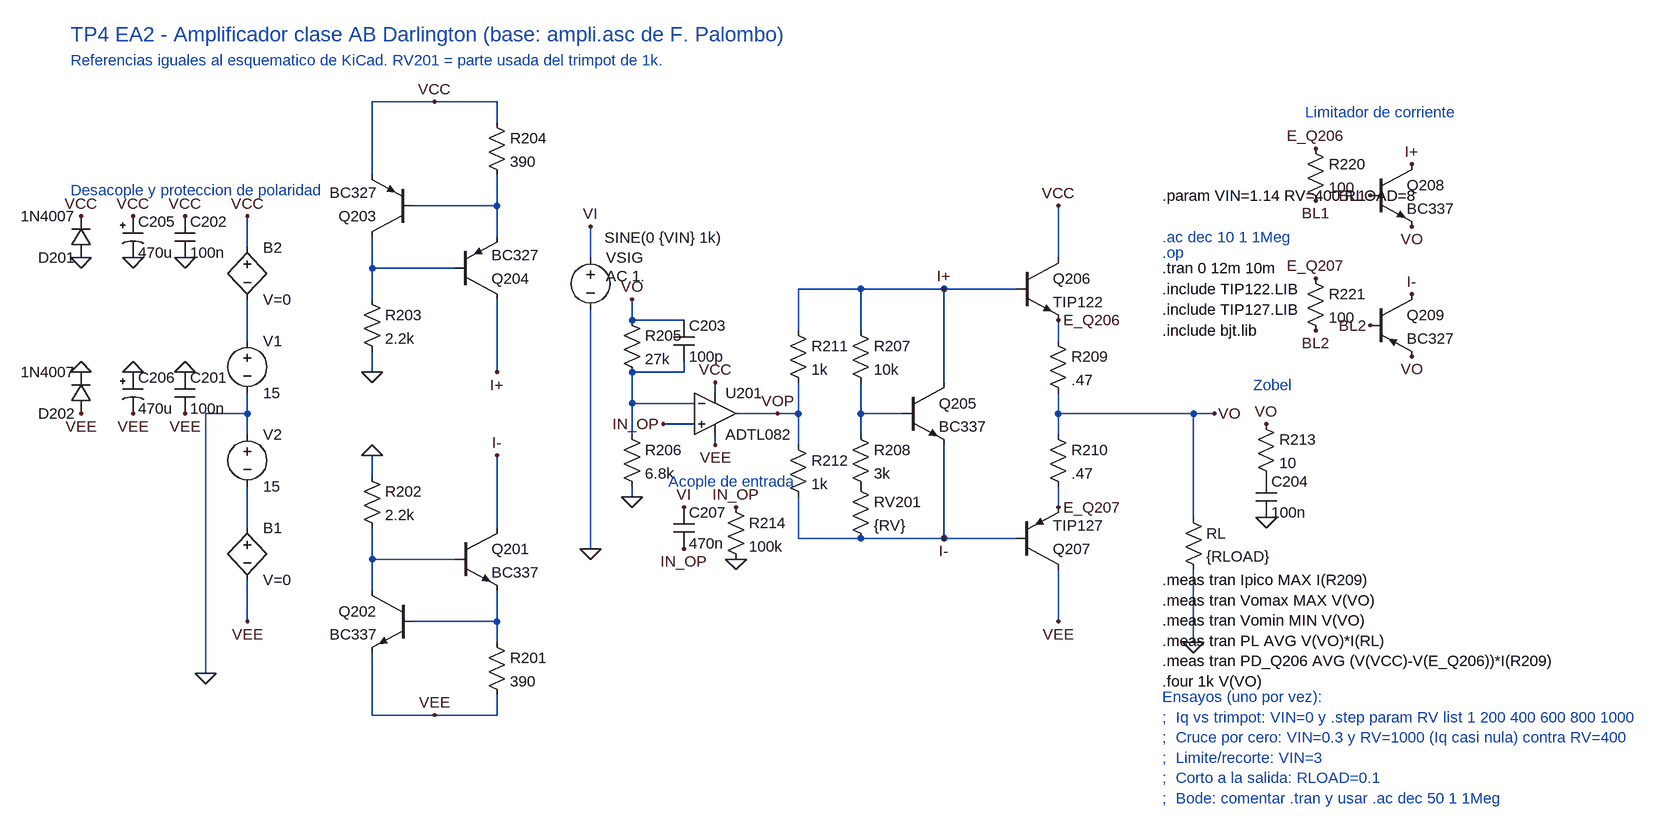
[diagram p0: schematic ampli.asc]
ampli.asc, the LTspice schematic file:
Version 4.1
SHEET 1 1440 1176
WIRE -640 -176 -736 -176
WIRE -544 -176 -640 -176
WIRE -544 -144 -544 -176
WIRE -736 -64 -736 -176
WIRE -544 -16 -544 -64
WIRE -544 -16 -672 -16
WIRE -544 32 -544 -16
WIRE -928 48 -928 0
WIRE -400 64 -400 16
WIRE 320 64 320 -16
WIRE -736 80 -736 32
WIRE -608 80 -736 80
WIRE 16 112 -80 112
WIRE 144 112 16 112
WIRE 256 112 144 112
WIRE -736 128 -736 80
WIRE -336 160 -336 128
WIRE -256 160 -336 160
WIRE -80 176 -80 112
WIRE 16 176 16 112
WIRE -928 192 -928 128
WIRE 320 192 320 160
WIRE -736 240 -736 208
WIRE -544 240 -544 128
WIRE -256 240 -256 224
WIRE -256 240 -336 240
WIRE 144 256 144 112
WIRE -208 272 -208 256
WIRE -336 288 -336 240
WIRE -240 288 -336 288
WIRE -928 304 -928 272
WIRE -928 304 -992 304
WIRE -112 304 -176 304
WIRE -80 304 -80 256
WIRE -80 304 -112 304
WIRE 16 304 16 256
WIRE 80 304 16 304
WIRE 320 304 320 272
WIRE 528 304 320 304
WIRE 560 304 528 304
WIRE -240 320 -288 320
WIRE -928 336 -928 304
WIRE -336 336 -336 288
WIRE 320 336 320 304
WIRE -208 352 -208 336
WIRE -80 352 -80 304
WIRE 16 336 16 304
WIRE -736 400 -736 368
WIRE -336 432 -336 416
WIRE 320 448 320 416
WIRE 528 464 528 304
WIRE -928 480 -928 416
WIRE -544 480 -544 368
WIRE -80 496 -80 432
WIRE 16 496 -80 496
WIRE 144 496 144 352
WIRE 144 496 16 496
WIRE 256 496 144 496
WIRE -400 512 -400 144
WIRE -736 528 -736 480
WIRE -608 528 -736 528
WIRE -736 576 -736 528
WIRE -928 624 -928 560
WIRE -544 624 -544 576
WIRE -544 624 -672 624
WIRE 320 624 320 544
WIRE -544 656 -544 624
WIRE 528 656 528 544
WIRE -992 704 -992 304
WIRE -736 768 -736 672
WIRE -640 768 -736 768
WIRE -544 768 -544 736
WIRE -544 768 -640 768
FLAG 528 656 0
FLAG -928 0 VCC
FLAG -928 624 VEE
FLAG -992 704 0
FLAG -400 512 0
FLAG -400 16 VI
FLAG 320 -16 VCC
FLAG 320 624 VEE
FLAG 560 304 VO
FLAG -208 352 VEE
FLAG -208 256 VCC
FLAG -288 320 IN_OP
FLAG -336 128 VO
FLAG -336 432 0
FLAG -640 -176 VCC
FLAG -736 240 0
FLAG -544 240 I+
FLAG 144 112 I+
FLAG 144 496 I-
FLAG -736 368 0
FLAG -640 768 VEE
FLAG -544 368 I-
FLAG -112 304 VOP
DATAFLAG 64 112 ""
DATAFLAG 64 496 ""
FLAG 320 160 E_Q206
FLAG 320 448 E_Q207
FLAG -256 448 VI
FLAG -256 512 IN_OP
FLAG -176 448 IN_OP
FLAG -176 528 0
FLAG 640 320 VO
FLAG 640 464 0
FLAG -1104 0 VCC
FLAG -1104 64 0
FLAG -1024 0 VCC
FLAG -1024 64 0
FLAG -1184 64 0
FLAG -1184 0 VCC
FLAG -1104 240 0
FLAG -1104 304 VEE
FLAG -1024 240 0
FLAG -1024 304 VEE
FLAG -1184 304 VEE
FLAG -1184 240 0
FLAG 864 -80 I+
FLAG 800 -32 BL1
FLAG 864 16 VO
FLAG 716 -104 E_Q206
FLAG 716 -24 BL1
FLAG 864 120 I-
FLAG 800 168 BL2
FLAG 864 216 VO
FLAG 716 96 E_Q207
FLAG 716 176 BL2
SYMBOL res 304 176 R0
SYMATTR InstName R209
SYMATTR Value .47
SYMBOL res 304 320 R0
SYMATTR InstName R210
SYMATTR Value .47
SYMBOL res 512 448 R0
SYMATTR InstName RL
SYMATTR Value {RLOAD}
SYMBOL voltage -928 176 R0
WINDOW 123 0 0 Left 0
WINDOW 39 0 0 Left 0
SYMATTR InstName V1
SYMATTR Value 15
SYMBOL voltage -928 320 R0
WINDOW 123 0 0 Left 0
WINDOW 39 0 0 Left 0
SYMATTR InstName V2
SYMATTR Value 15
SYMBOL bv -928 464 R0
SYMATTR InstName B1
SYMATTR Value V=0
SYMBOL bv -928 32 R0
SYMATTR InstName B2
SYMATTR Value V=0
SYMBOL voltage -400 48 R0
WINDOW 3 22 -15 Left 2
WINDOW 123 24 44 Left 2
WINDOW 39 0 0 Left 0
SYMATTR Value SINE(0 {VIN} 1k)
SYMATTR Value2 AC 1.
SYMATTR InstName VSIG
SYMBOL npn 80 256 R0
SYMATTR InstName Q205
SYMATTR Value BC337
SYMBOL res 0 320 R0
SYMATTR InstName R208
SYMATTR Value 3k
SYMBOL res 0 160 R0
SYMATTR InstName R207
SYMATTR Value 10k
SYMBOL pnp 256 544 M180
SYMATTR InstName Q207
SYMATTR Value TIP127
SYMATTR Prefix XP
SYMBOL npn 256 64 R0
SYMATTR InstName Q206
SYMATTR Value TIP122
SYMATTR Prefix XN
SYMBOL OpAmps\\ADTL082 -208 240 R0
SYMATTR InstName U201
SYMBOL res -352 320 R0
SYMATTR InstName R206
SYMATTR Value 6.8k
SYMBOL res -352 144 R0
SYMATTR InstName R205
SYMATTR Value 27k
SYMBOL pnp -608 128 M180
SYMATTR InstName Q204
SYMATTR Value BC327
SYMBOL pnp -672 32 R180
SYMATTR InstName Q203
SYMATTR Value BC327
SYMBOL res -560 -160 R0
SYMATTR InstName R204
SYMATTR Value 390
SYMBOL res -752 112 R0
SYMATTR InstName R203
SYMATTR Value 2.2k
SYMBOL res -752 384 R0
SYMATTR InstName R202
SYMATTR Value 2.2k
SYMBOL npn -608 480 R0
SYMATTR InstName Q201
SYMATTR Value BC337
SYMBOL npn -672 576 M0
SYMATTR InstName Q202
SYMATTR Value BC337
SYMBOL res -560 640 R0
SYMATTR InstName R201
SYMATTR Value 390
SYMBOL res -96 160 R0
SYMATTR InstName R211
SYMATTR Value 1k
SYMBOL res -96 336 R0
SYMATTR InstName R212
SYMATTR Value 1k
SYMBOL cap -272 160 R0
SYMATTR InstName C203
SYMATTR Value 100p
SYMBOL res 0 400 R0
SYMATTR InstName RV201
SYMATTR Value {RV}
SYMBOL cap -272 448 R0
SYMATTR InstName C207
SYMATTR Value 470n
SYMBOL res -192 432 R0
SYMATTR InstName R214
SYMATTR Value 100k
SYMBOL res 624 304 R0
SYMATTR InstName R213
SYMATTR Value 10
SYMBOL cap 624 400 R0
SYMATTR InstName C204
SYMATTR Value 100n
SYMBOL polcap -1120 0 R0
SYMATTR InstName C205
SYMATTR Value 470u
SYMBOL cap -1040 0 R0
SYMATTR InstName C202
SYMATTR Value 100n
SYMBOL diode -1168 64 R180
SYMATTR InstName D201
SYMATTR Value 1N4007
SYMBOL polcap -1120 240 R0
SYMATTR InstName C206
SYMATTR Value 470u
SYMBOL cap -1040 240 R0
SYMATTR InstName C201
SYMATTR Value 100n
SYMBOL diode -1168 304 R180
SYMATTR InstName D202
SYMATTR Value 1N4007
SYMBOL npn 800 -80 R0
SYMATTR InstName Q208
SYMATTR Value BC337
SYMBOL res 700 -120 R0
SYMATTR InstName R220
SYMATTR Value 100
SYMBOL pnp 800 120 R0
SYMATTR InstName Q209
SYMATTR Value BC327
SYMBOL res 700 80 R0
SYMATTR InstName R221
SYMATTR Value 100
TEXT 480 112 Left 2 !.include TIP122.LIB
TEXT 480 144 Left 2 !.include TIP127.LIB
TEXT 480 80 Left 2 !.tran 0 12m 10m
TEXT 480 56 Left 2 ;.op
TEXT 480 32 Left 2 ;.ac dec 10 1 1Meg
TEXT 480 176 Left 2 !.include bjt.lib
TEXT 480 -32 Left 2 !.param VIN=1.14 RV=400 RLOAD=8
TEXT -1200 -280 Left 3 ;TP4 EA2 - Amplificador clase AB Darlington (base: ampli.asc de F. Palombo)
TEXT -1200 -240 Left 2 ;Referencias iguales al esquematico de KiCad. RV201 = parte usada del trimpot de 1k.
TEXT 700 -160 Left 2 ;Limitador de corriente
TEXT 620 260 Left 2 ;Zobel
TEXT -1200 -40 Left 2 ;Desacople y proteccion de polaridad
TEXT -280 408 Left 2 ;Acople de entrada
TEXT 480 560 Left 2 !.meas tran Ipico MAX I(R209)\n.meas tran Vomax MAX V(VO)\n.meas tran Vomin MIN V(VO)\n.meas tran PL AVG V(VO)*I(RL)\n.meas tran PD_Q206 AVG (V(VCC)-V(E_Q206))*I(R209)\n.four 1k V(VO)
TEXT 480 740 Left 2 ;Ensayos (uno por vez):\n;  Iq vs trimpot: VIN=0 y .step param RV list 1 200 400 600 800 1000\n;  Cruce por cero: VIN=0.3 y RV=1000 (Iq casi nula) contra RV=400\n;  Limite/recorte: VIN=3\n;  Corto a la salida: RLOAD=0.1\n;  Bode: comentar .tran y usar .ac dec 50 1 1Meg

The netlist it stands for:
* ampli.asc
R209 E_Q206 VO .47
R210 VO E_Q207 .47
RL VO 0 {RLOAD}
V1 N003 0 15
V2 0 N006 15
B1 N006 VEE V=0
B2 VCC N003 V=0
VSIG VI 0 SINE(0 {VIN} 1k) AC 1.
Q205 I+ N005 I- 0 BC337
R208 N005 P001 3k
R207 I+ N005 10k
X§Q207 VEE I- E_Q207 TIP127  ; pins C B E
X§Q206 VCC I+ E_Q206 TIP122  ; pins C B E
X§U201 IN_OP N004 VCC VEE VOP ADTL082  ; pins In+ In- V+ V- OUT
R206 N004 0 6.8k
R205 VO N004 27k
Q204 I+ N002 N001 0 BC327
Q203 N002 N001 VCC 0 BC327
R204 VCC N001 390
R203 N002 0 2.2k
R202 0 N007 2.2k
Q201 I- N007 N008 0 BC337
Q202 N007 N008 VEE 0 BC337
R201 N008 VEE 390
R211 I+ VOP 1k
R212 VOP I- 1k
C203 VO N004 100p
RV201 P001 I- {RV}
C207 VI IN_OP 470n
R214 IN_OP 0 100k
R213 VO P002 10
C204 P002 0 100n
C205 VCC 0 470u
C202 VCC 0 100n
D201 0 VCC 1N4007
C206 0 VEE 470u
C201 0 VEE 100n
D202 VEE 0 1N4007
Q208 I+ BL1 VO 0 BC337
R220 E_Q206 BL1 100
Q209 I- BL2 VO 0 BC327
R221 E_Q207 BL2 100
.model D D
.lib standard.dio
.model NPN NPN
.model PNP PNP
.lib standard.bjt
.include TIP122.LIB
.include TIP127.LIB
.tran 0 12m 10m
* .op
* .ac dec 10 1 1Meg
.include bjt.lib
.param VIN=1.14 RV=400 RLOAD=8
* TP4 EA2 - Amplificador clase AB Darlington (base: ampli.asc de F. Palombo)
* Referencias iguales al esquematico de KiCad. RV201 = parte usada del trimpot de 1k.
* Limitador de corriente
* Zobel
* Desacople y proteccion de polaridad
* Acople de entrada
.meas tran Ipico MAX I(R209)
.meas tran Vomax MAX V(VO)
.meas tran Vomin MIN V(VO)
.meas tran PL AVG V(VO)*I(RL)
.meas tran PD_Q206 AVG (V(VCC)-V(E_Q206))*I(R209)
.four 1k V(VO)
* Ensayos (uno por vez):
* ;  Iq vs trimpot: VIN=0 y .step param RV list 1 200 400 600 800 1000
* ;  Cruce por cero: VIN=0.3 y RV=1000 (Iq casi nula) contra RV=400
* ;  Limite/recorte: VIN=3
* ;  Corto a la salida: RLOAD=0.1
* ;  Bode: comentar .tran y usar .ac dec 50 1 1Meg
.lib ADI.lib
.backanno
.end